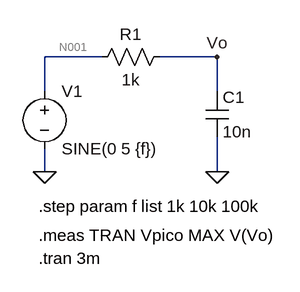
[diagram p0: schematic Meas.asc]
Meas.asc, the LTspice schematic file:
Version 4.1
SHEET 1 880 680
WIRE 160 80 80 80
WIRE 320 80 240 80
WIRE 80 128 80 80
WIRE 320 128 320 80
WIRE 80 240 80 208
WIRE 320 240 320 192
FLAG 80 240 0
FLAG 320 240 0
FLAG 320 80 Vo
SYMBOL voltage 80 112 R0
WINDOW 123 0 0 Left 0
WINDOW 39 0 0 Left 0
SYMATTR InstName V1
SYMATTR Value SINE(0 5 {f})
SYMBOL res 256 64 R90
WINDOW 0 0 56 VBottom 2
WINDOW 3 32 56 VTop 2
SYMATTR InstName R1
SYMATTR Value 1k
SYMBOL cap 304 128 R0
SYMATTR InstName C1
SYMATTR Value 10n
TEXT 72 288 Left 2 !.step param f list 1k 10k 100k
TEXT 72 328 Left 2 !.meas TRAN Vpico MAX V(Vo)
TEXT 72 360 Left 2 !.tran 3m

The netlist it stands for:
* Meas.asc
V1 N001 0 SINE(0 5 {f})
R1 Vo N001 1k
C1 Vo 0 10n
.step param f list 1k 10k 100k
.meas TRAN Vpico MAX V(Vo)
.tran 3m
.backanno
.end

* Results of the author's LTspice run, read from the files saved beside the schematic
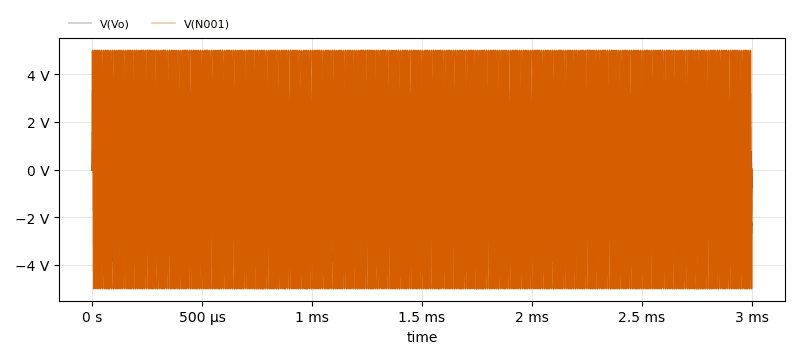
[diagram p1: Transient Analysis of Meas.asc, plotted from the saved traces]
* Transient Analysis, 3 runs:
*   V(Vo) [f=1000]: min -4.99 V, max 4.99 V, average 1.043 mV, rms 3.529 V, last -312.9 mV
*   V(Vo) [f=10000]: min -4.23 V, max 4.305 V, average 7.512 mV, rms 2.993 V, last -2.255 V
*   V(Vo) [f=100000]: min -772.2 mV, max 1.252 V, average 2.572 mV, rms 541.3 mV, last -762.8 mV
*   V(N001) [f=1000]: min -5 V, max 5 V, average 0 V, rms 3.536 V, last 0 V
*   V(N001) [f=10000]: min -5 V, max 5 V, average -3.021 µV, rms 3.536 V, last 0 V
*   V(N001) [f=100000]: min -5 V, max 5 V, average 29.14 µV, rms 3.591 V, last 0 V
* From the log:
*   Measurement: vpico
*     step  MAX(V(Vo))  FROM  TO
*        1  4.99015760422  0  0.003
*        2  4.30545473099  0  0.003
*        3  1.2524086237  0  0.003